# Altium project DC-Motor-Driver-v1.0.PrjPcb (part 1 of 3)
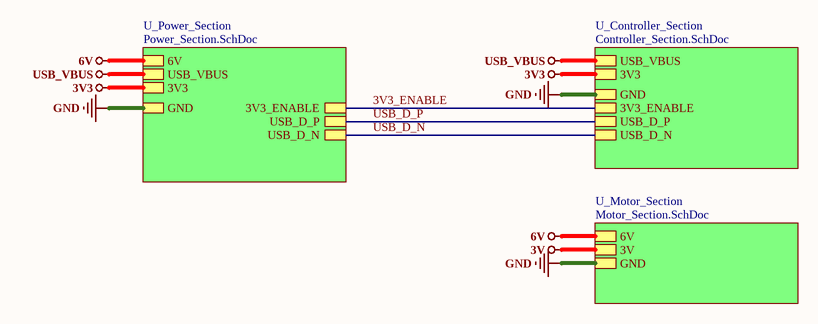
[diagram p0: TopSheet.SchDoc]
4 sheets, 133 parts. Net scope: global (net labels, ports and power ports of the same name join across sheets).
Board file: DC-Motor-Driver-v1.0.PcbDoc
Sheets:
  TopSheet.SchDoc
    U_Motor_Section = Motor_Section.SchDoc
    U_Power_Section = Power_Section.SchDoc
    U_Controller_Section = Controller_Section.SchDoc

## Sheet TopSheet.SchDoc
size A4; SheetNumber: 1; SheetTotal: 4

### Sub-sheets
U_Controller_Section = Controller_Section.SchDoc: GND, USB_VBUS, 3V3, USB_D_N, USB_D_P, 3V3_ENABLE
U_Motor_Section = Motor_Section.SchDoc: 3V, 6V, GND
U_Power_Section = Power_Section.SchDoc: GND, USB_VBUS, 3V3, 6V, USB_D_P, USB_D_N, 3V3_ENABLE

### Nets
3V: sheet U_Motor_Section/3V
3V3: sheet U_Power_Section/3V3, sheet U_Controller_Section/3V3
6V: sheet U_Motor_Section/6V, sheet U_Power_Section/6V
GND: sheet U_Motor_Section/GND, sheet U_Power_Section/GND, sheet U_Controller_Section/GND
USB_VBUS: sheet U_Power_Section/USB_VBUS, sheet U_Controller_Section/USB_VBUS
3V3_ENABLE: sheet U_Power_Section/3V3_ENABLE, sheet U_Controller_Section/3V3_ENABLE
USB_D_N: sheet U_Power_Section/USB_D_N, sheet U_Controller_Section/USB_D_N
USB_D_P: sheet U_Power_Section/USB_D_P, sheet U_Controller_Section/USB_D_P

### Notes on the sheet
- File:
- Title:
- Date:
- Page
- Num:
- Total:
- Drawn By: Huzaifa Ali

## Sheet Motor_Section.SchDoc
size 420 x 297 mm; SheetNumber: 4; SheetTotal: 4
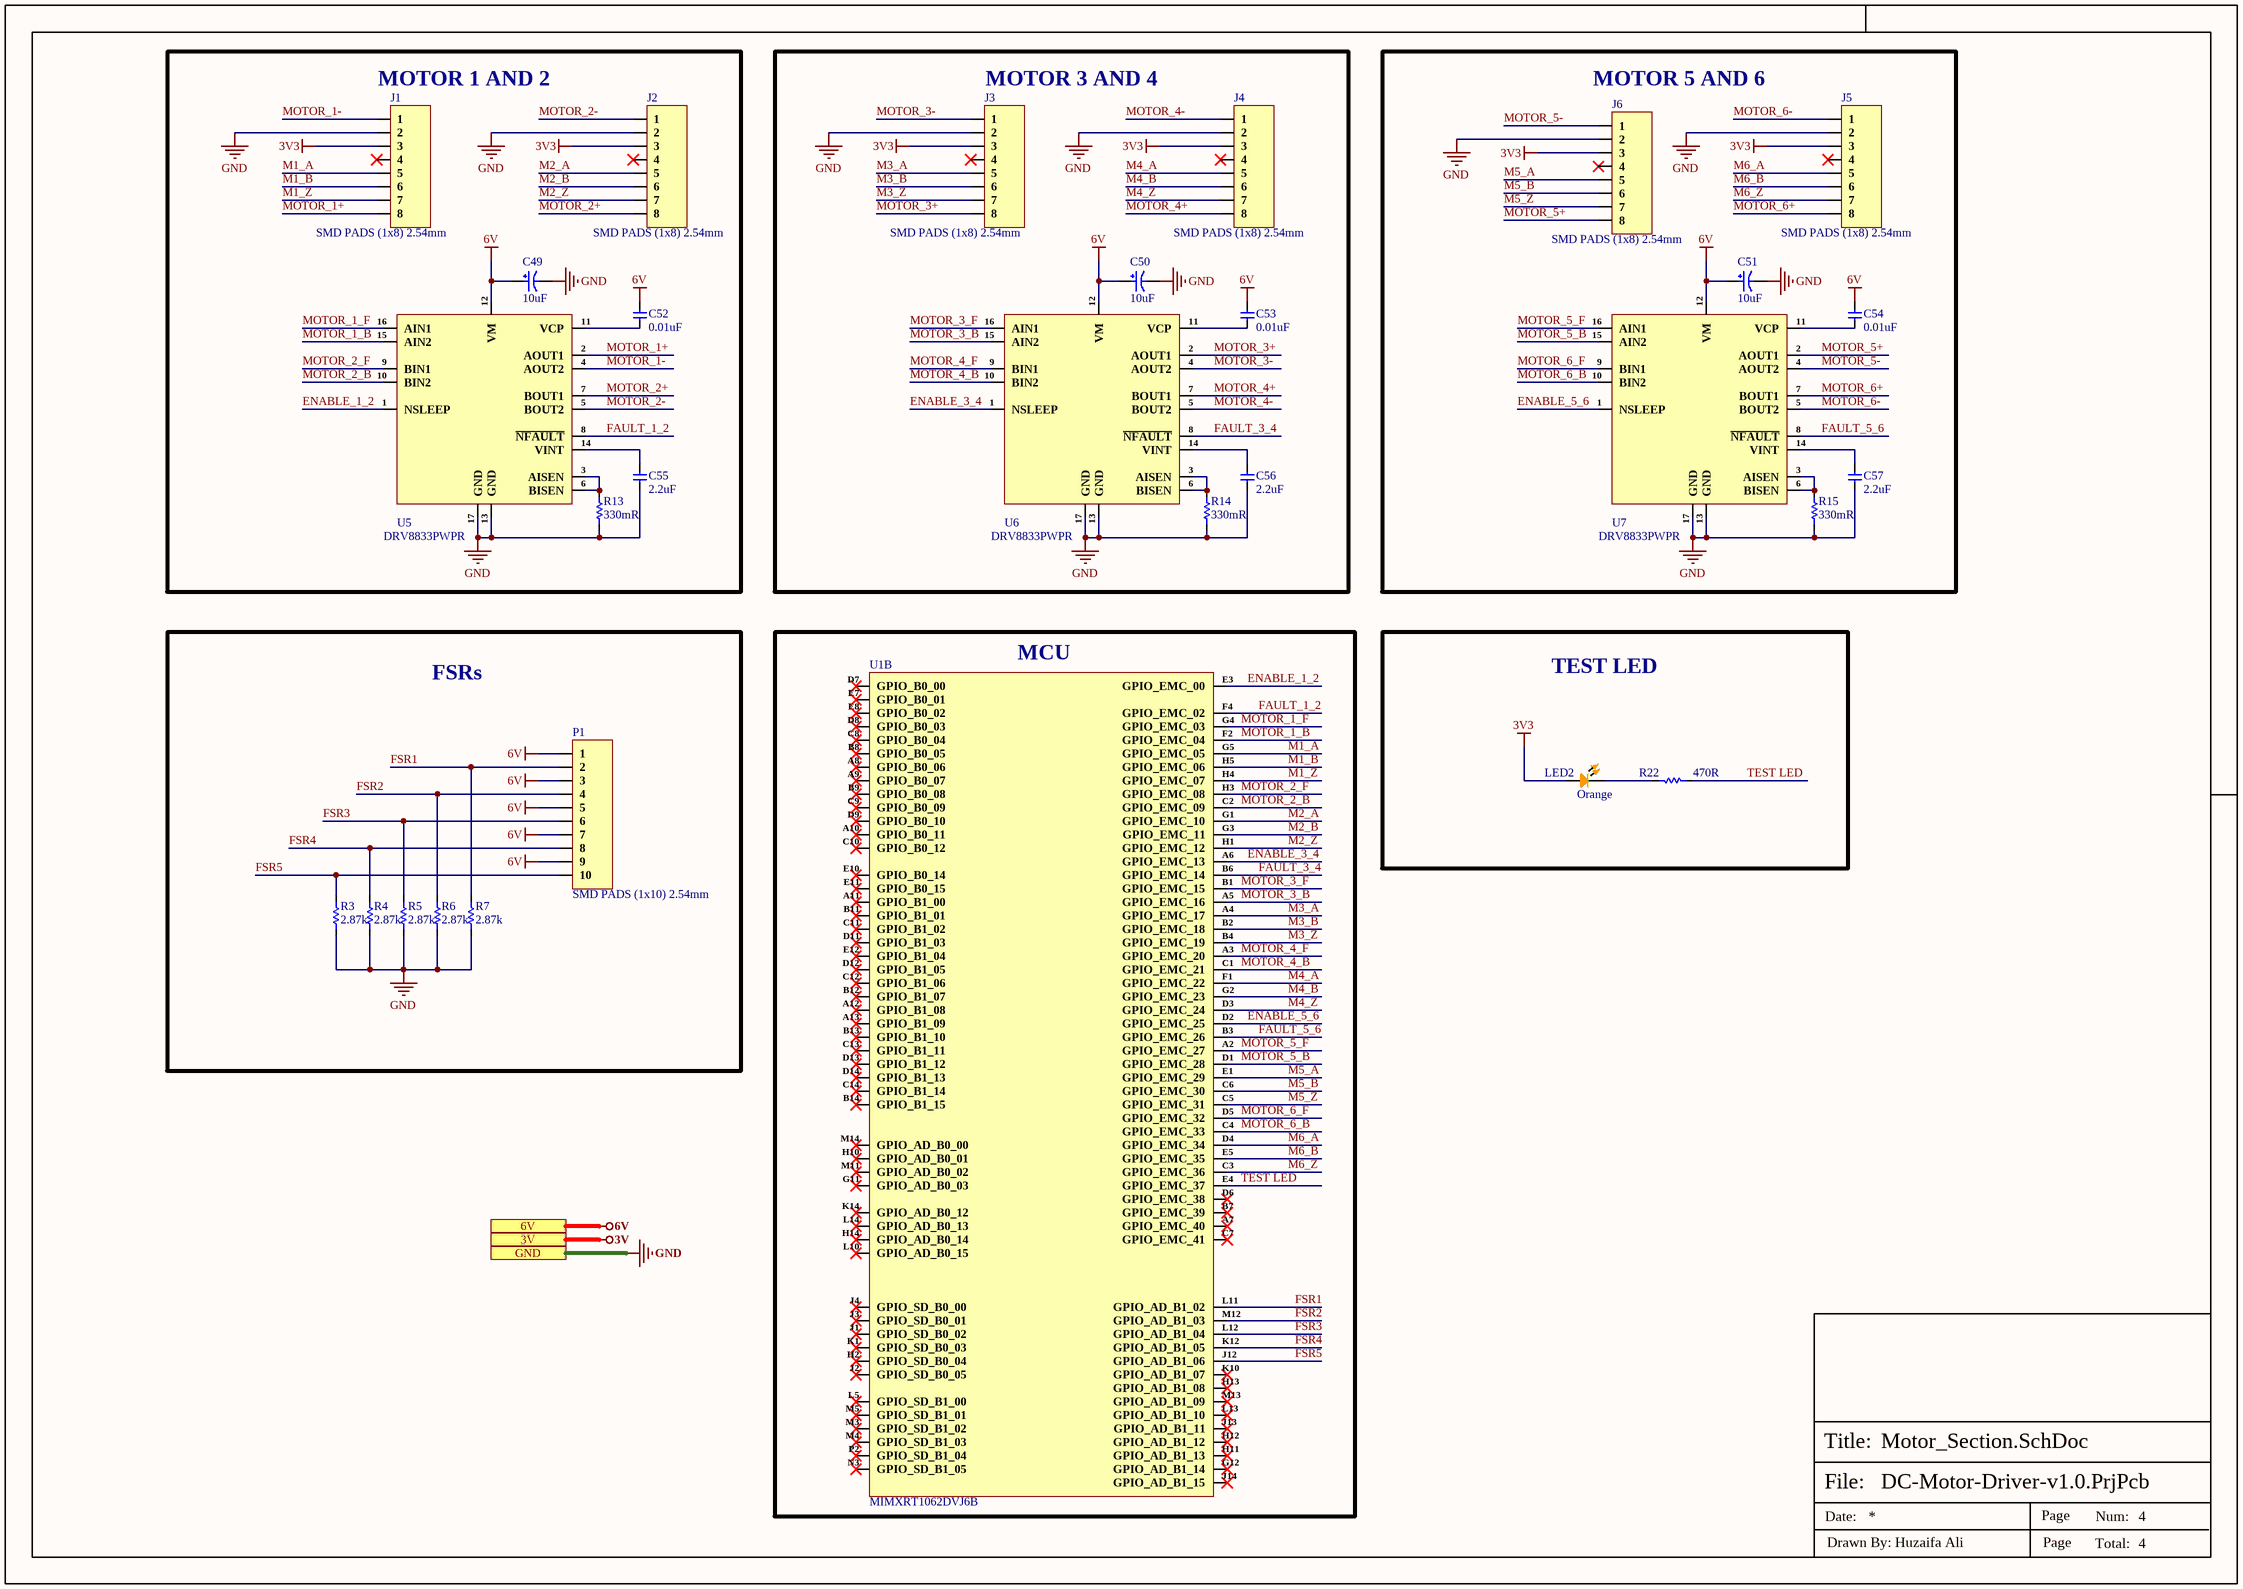
[diagram p1: Motor_Section.SchDoc]

### Parts
C49  10uF  [Case-A]
C50  10uF  [Case-A]
C51  10uF  [Case-A]
C52  0.01uF  [Cap-0402]
C53  0.01uF  [Cap-0402]
C54  0.01uF  [Cap-0402]
C55  2.2uF  [CAP-0603]
C56  2.2uF  [CAP-0603]
C57  2.2uF  [CAP-0603]
J1  SMD PADS (1x8) 2.54mm  [SMD PADS (1x8) 2.54mm]
J2  SMD PADS (1x8) 2.54mm  [SMD PADS (1x8) 2.54mm]
J3  SMD PADS (1x8) 2.54mm  [SMD PADS (1x8) 2.54mm]
J4  SMD PADS (1x8) 2.54mm  [SMD PADS (1x8) 2.54mm]
J5  SMD PADS (1x8) 2.54mm  [SMD PADS (1x8) 2.54mm]
J6  SMD PADS (1x8) 2.54mm  [SMD PADS (1x8) 2.54mm]
LED2  Orange  [LED-0805]
P1  SMD PADS (1x10) 2.54mm  [SMD PADS (1x10) 2.54mm]
R3  2.87k  [Res-0402]
R4  2.87k  [Res-0402]
R5  2.87k  [Res-0402]
R6  2.87k  [Res-0402]
R7  2.87k  [Res-0402]
R13  330mR  [Res-1206]
R14  330mR  [Res-1206]
R15  330mR  [Res-1206]
R22  470R  [Res-0201]
U1  MIMXRT1062DVJ6B  [196-LFBGA (12x12)]  (part B of 2)
U5  DRV8833PWPR  [HTSSOP-16]
U6  DRV8833PWPR  [HTSSOP-16]
U7  DRV8833PWPR  [HTSSOP-16]

### Blocks framed on the sheet
MOTOR 1 AND 2: C49 C52 C55 J1 J2 R13 U5
MOTOR 3 AND 4: C50 C53 C56 J3 J4 R14 U6
MOTOR 5 AND 6: C51 C54 C57 J5 J6 R15 U7
FSRs: P1 R3-R7
MCU: U1
TEST LED: LED2 R22

### Ports
3V, 6V, GND

### Nets
3V: port 3V
3V3: J1.3 J2.3 J3.3 J4.3 J5.3 J6.3 LED2.1
6V: C49.1 C50.1 C51.1 C52.2 C53.2 C54.2 P1.1 P1.3 P1.5 P1.7 P1.9 U5.12(VM) U6.12(VM) U7.12(VM) ; port 6V
GND: C49.2 C50.2 C51.2 C55.1 C56.1 C57.1 J1.2 J2.2 J3.2 J4.2 J5.2 J6.2 R3.1 R4.1 R5.1 R6.1 R7.1 R13.1 R14.1 R15.1 U5.13(GND) U5.17(GND) U6.13(GND) U6.17(GND) U7.13(GND) U7.17(GND) ; port GND
ENABLE_1_2: U1.E3(GPIO_EMC_00) U5.1(NSLEEP)
ENABLE_3_4: U1.A6(GPIO_EMC_13) U6.1(NSLEEP)
ENABLE_5_6: U1.D2(GPIO_EMC_25) U7.1(NSLEEP)
FAULT_1_2: U1.F4(GPIO_EMC_02) U5.8(~{NFAULT})
FAULT_3_4: U1.B6(GPIO_EMC_14) U6.8(~{NFAULT})
FAULT_5_6: U1.B3(GPIO_EMC_26) U7.8(~{NFAULT})
FSR1: P1.2 R7.2 U1.L11(GPIO_AD_B1_02)
FSR2: P1.4 R6.2 U1.M12(GPIO_AD_B1_03)
FSR3: P1.6 R5.2 U1.L12(GPIO_AD_B1_04)
FSR4: P1.8 R4.2 U1.K12(GPIO_AD_B1_05)
FSR5: P1.10 R3.2 U1.J12(GPIO_AD_B1_06)
M1_A: J1.5 U1.G5(GPIO_EMC_05)
M1_B: J1.6 U1.H5(GPIO_EMC_06)
M1_Z: J1.7 U1.H4(GPIO_EMC_07)
M2_A: J2.5 U1.G1(GPIO_EMC_10)
M2_B: J2.6 U1.G3(GPIO_EMC_11)
M2_Z: J2.7 U1.H1(GPIO_EMC_12)
M3_A: J3.5 U1.A4(GPIO_EMC_17)
M3_B: J3.6 U1.B2(GPIO_EMC_18)
M3_Z: J3.7 U1.B4(GPIO_EMC_19)
M4_A: J4.5 U1.F1(GPIO_EMC_22)
M4_B: J4.6 U1.G2(GPIO_EMC_23)
M4_Z: J4.7 U1.D3(GPIO_EMC_24)
M5_A: J6.5 U1.E1(GPIO_EMC_29)
M5_B: J6.6 U1.C6(GPIO_EMC_30)
M5_Z: J6.7 U1.C5(GPIO_EMC_31)
M6_A: J5.5 U1.D4(GPIO_EMC_34)
M6_B: J5.6 U1.E5(GPIO_EMC_35)
M6_Z: J5.7 U1.C3(GPIO_EMC_36)
MOTOR_1+: J1.8 U5.2(AOUT1)
MOTOR_1-: J1.1 U5.4(AOUT2)
MOTOR_1_B: U1.F2(GPIO_EMC_04) U5.15(AIN2)
MOTOR_1_F: U1.G4(GPIO_EMC_03) U5.16(AIN1)
MOTOR_2+: J2.8 U5.7(BOUT1)
MOTOR_2-: J2.1 U5.5(BOUT2)
MOTOR_2_B: U1.C2(GPIO_EMC_09) U5.10(BIN2)
MOTOR_2_F: U1.H3(GPIO_EMC_08) U5.9(BIN1)
MOTOR_3+: J3.8 U6.2(AOUT1)
MOTOR_3-: J3.1 U6.4(AOUT2)
MOTOR_3_B: U1.A5(GPIO_EMC_16) U6.15(AIN2)
MOTOR_3_F: U1.B1(GPIO_EMC_15) U6.16(AIN1)
MOTOR_4+: J4.8 U6.7(BOUT1)
MOTOR_4-: J4.1 U6.5(BOUT2)
MOTOR_4_B: U1.C1(GPIO_EMC_21) U6.10(BIN2)
MOTOR_4_F: U1.A3(GPIO_EMC_20) U6.9(BIN1)
MOTOR_5+: J6.8 U7.2(AOUT1)
MOTOR_5-: J6.1 U7.4(AOUT2)
MOTOR_5_B: U1.D1(GPIO_EMC_28) U7.15(AIN2)
MOTOR_5_F: U1.A2(GPIO_EMC_27) U7.16(AIN1)
MOTOR_6+: J5.8 U7.7(BOUT1)
MOTOR_6-: J5.1 U7.5(BOUT2)
MOTOR_6_B: U1.C4(GPIO_EMC_33) U7.10(BIN2)
MOTOR_6_F: U1.D5(GPIO_EMC_32) U7.9(BIN1)
TEST LED: R22.1 U1.E4(GPIO_EMC_37)
NetC52_1: C52.1 U5.11(VCP)
NetC53_1: C53.1 U6.11(VCP)
NetC54_1: C54.1 U7.11(VCP)
NetC55_2: C55.2 U5.14(VINT)
NetC56_2: C56.2 U6.14(VINT)
NetC57_2: C57.2 U7.14(VINT)
NetLED2_2: LED2.2 R22.2
NetR13_2: R13.2 U5.3(AISEN) U5.6(BISEN)
NetR14_2: R14.2 U6.3(AISEN) U6.6(BISEN)
NetR15_2: R15.2 U7.3(AISEN) U7.6(BISEN)

Not connected (* = marked no-connect by the designer): J1 4*; J2 4*; J3 4*; J4 4*; J5 4*; J6 4*; U1 A7(GPIO_EMC_40)* A8(GPIO_B0_06)* A9(GPIO_B0_07)* A10(GPIO_B0_11)* A11(GPIO_B1_00)* A12(GPIO_B1_08)* A13(GPIO_B1_09)* B7(GPIO_EMC_39)* B8(GPIO_B0_05)* B9(GPIO_B0_08)* B11(GPIO_B1_01)* B12(GPIO_B1_07)* B13(GPIO_B1_10)* B14(GPIO_B1_15)* C7(GPIO_EMC_41)* C8(GPIO_B0_04)* C9(GPIO_B0_09)* C10(GPIO_B0_12)* C11(GPIO_B1_02)* C12(GPIO_B1_06)* C13(GPIO_B1_11)* C14(GPIO_B1_14)* D6(GPIO_EMC_38)* D7(GPIO_B0_00)* D8(GPIO_B0_03)* D9(GPIO_B0_10)* D11(GPIO_B1_03)* D12(GPIO_B1_05)* D13(GPIO_B1_12)* D14(GPIO_B1_13)* E7(GPIO_B0_01)* E8(GPIO_B0_02)* E10(GPIO_B0_14)* E11(GPIO_B0_15)* E12(GPIO_B1_04)* G11(GPIO_AD_B0_03)* G12(GPIO_AD_B1_14)* H2(GPIO_SD_B0_04)* H10(GPIO_AD_B0_01)* H11(GPIO_AD_B1_13)* H12(GPIO_AD_B1_12)* H13(GPIO_AD_B1_08)* H14(GPIO_AD_B0_14)* J1(GPIO_SD_B0_02)* J2(GPIO_SD_B0_05)* J3(GPIO_SD_B0_01)* J4(GPIO_SD_B0_00)* J13(GPIO_AD_B1_11)* J14(GPIO_AD_B1_15)* K1(GPIO_SD_B0_03)* K10(GPIO_AD_B1_07)* K14(GPIO_AD_B0_12)* L5(GPIO_SD_B1_00)* L10(GPIO_AD_B0_15)* L13(GPIO_AD_B1_10)* L14(GPIO_AD_B0_13)* M3(GPIO_SD_B1_02)* M4(GPIO_SD_B1_03)* M5(GPIO_SD_B1_01)* M11(GPIO_AD_B0_02)* M13(GPIO_AD_B1_09)* M14(GPIO_AD_B0_00)* N3(GPIO_SD_B1_05)* P2(GPIO_SD_B1_04)*

### Notes on the sheet
- File:
- Title:
- Date:
- Page
- Num:
- Total:
- Drawn By: Huzaifa Ali

### Library data of the parts
C49-C51 = T491A106K016AT: CAP TANT 10UF 10% 16V 1206; Manufacturer: KEMET; Item Type: Capacitor; Supplier 1: Mouser; Manufacturer Part Number: T491A106K016AT; RoHS: Yes; Category: Tantalum Capacitors; Stock 1: 340138; Pricing 1: 1=0.34, 10=0.214, 50=0.214, 100=0.163, 1000=0.118, 10000=0.096 (USD); ComponentLink1URL: https://datasheet.ciiva.com/34302/1573257-34302505.pdf?src-supplier=Jameco; ComponentLink1Description: https://datasheet.ciiva.com/34302/1573257-34302505.pdf?src-supplier=Jameco; ComponentLink2URL: https://datasheet.ciiva.com/7696/1732745-7696294.pdf?src-supplier=Element14; ComponentLink2Description: https://datasheet.ciiva.com/7696/1732745-7696294.pdf?src-supplier=Element14; ComponentLink3URL: https://datasheet.ciiva.com/12882/kem-t2005-t491-12882730.pdf?src-supplier=Mouser; ComponentLink3Description: https://datasheet.ciiva.com/12882/kem-t2005-t491-12882730.pdf?src-supplier=Mouser; ComponentLink4URL: https://datasheet.ciiva.com/6248/kem-t2005-t491-6248087.pdf?src-supplier=Digi-Key; ComponentLink4Description: https://datasheet.ciiva.com/6248/kem-t2005-t491-6248087.pdf?src-supplier=Digi-Key; ComponentLink5URL: https://datasheet.ciiva.com/6248/kem-t2005-t491-6248088.pdf?src-supplier=Digi-Key; ComponentLink5Description: https://datasheet.ciiva.com/6248/kem-t2005-t491-6248088.pdf?src-supplier=Digi-Key; ComponentLink6URL: https://datasheet.ciiva.com/6248/kem-t2005-t491-6248089.pdf?src-supplier=Digi-Key; ComponentLink6Description: https://datasheet.ciiva.com/6248/kem-t2005-t491-6248089.pdf?src-supplier=Digi-Key; ComponentLink7URL: https://datasheet.ciiva.com/14113/t491serie-eng-tds-14113132.pdf?src-supplier=Distrelec; ComponentLink7Description: https://datasheet.ciiva.com/14113/t491serie-eng-tds-14113132.pdf?src-supplier=Distrelec; ComponentLink8URL: https://datasheet.ciiva.com/14605/70095774-14605543.pdf?src-supplier=Allied+Electronics; ComponentLink8Description: https://datasheet.ciiva.com/14605/70095774-14605543.pdf?src-supplier=Allied+Electronics; ComponentLink9URL: https://datasheet.ciiva.com/14586/70095774-14586694.pdf?src-supplier=Allied+Electronics; ComponentLink9Description: https://datasheet.ciiva.com/14586/70095774-14586694.pdf?src-supplier=Allied+Electronics; ComponentLink10URL: https://datasheet.ciiva.com/39123/kem-t2005-t491-39123278.pdf?src-supplier=Onlinecomponents.com; ComponentLink10Description: https://datasheet.ciiva.com/39123/kem-t2005-t491-39123278.pdf?src-supplier=Onlinecomponents.com; ComponentLink11URL: https://datasheet.ciiva.com/7696/1854511-7696293.pdf?src-supplier=Element14; ComponentLink11Description: https://datasheet.ciiva.com/7696/1854511-7696293.pdf?src-supplier=Element14; ComponentLink12URL: https://datasheet.ciiva.com/7696/1854511-7696295.pdf?src-supplier=Element14; ComponentLink12Description: https://datasheet.ciiva.com/7696/1854511-7696295.pdf?src-supplier=Element14; ComponentLink13URL: https://datasheet.ciiva.com/7696/1446014-7696296.pdf?src-supplier=Element14; ComponentLink13Description: https://datasheet.ciiva.com/7696/1446014-7696296.pdf?src-supplier=Element14; ComponentLink14URL: https://datasheet.ciiva.com/7696/1923792-7696431.pdf?src-supplier=Element14; ComponentLink14Description: https://datasheet.ciiva.com/7696/1923792-7696431.pdf?src-supplier=Element14; ComponentLink15URL: https://datasheet.ciiva.com/29244/458306-da-01-de-kondensator-10uf-3216-10pr-16v-85c-29244588.pdf?src-supplier=Conrad; ComponentLink15Description: https://datasheet.ciiva.com/29244/458306-da-01-de-kondensator-10uf-3216-10pr-16v-85c-29244588.pdf?src-supplier=Conrad; LCSC Part Number: C110055; Supplier Part Number 1: 80-T491A106K016
C52-C54 = CC0402KRX5R8BB103: CAP CER 10000PF 25V X5R 0402; Manufacturer: Yageo; Item Type: Capacitor; Supplier 1: Future Electronics; Manufacturer Part Number: CC0402KRX5R8BB103; RoHS: Yes; Category: Ceramic Capacitors; Stock 1: 140000; Pricing 1: 10000=0.00290, 40000=0.00270, 150000=0.00260, 250000=0.00250, 500000=0.00240 (USD); RoHS Compliant: Yes; Supplier Part Number 1: 2101932; LCSC Part Number: C576726; ComponentLink1Description: LCSC; ComponentLink1URL: https://www.lcsc.com/product-detail/Multilayer-Ceramic-Capacitors-MLCC-SMD-SMT_YAGEO-CC0402KRX5R8BB103_C576726.html
C55-C57 = CC0603KRX5R8BB225: CAP CER 2.2UF 25V X5R 0603; Manufacturer: Yageo; Tolerance: 10%; Item Type: Capacitor; Supplier 1: Digi-Key; Manufacturer Part Number: CC0603KRX5R8BB225; Stock 1: 687936; Pricing 1: 1=0.4, 10=0.276, 50=0.1932, 100=0.1656, 500=0.1242, 1000=0.10488 (USD); Mount: Surface Mount; Case/Package: 0603; Case Code (Metric): 1608; Case Code (Imperial): 0603; Weight: 7.1E-05oz; Min Operating Temperature: -55°C; Max Operating Temperature: 85°C; Packaging: Tape and Reel; Capacitance: 2.2uF; Dielectric: X5R; Voltage Rating: 25V; Termination: SMD/SMT; Resistor Type: Ceramic; Voltage Rating (DC): 25V; Package Quantity: 4000; Length: 1.6mm; Width: 0.031inch; Thickness: 0.037inch; Depth: 0.8mm; Radiation Hardening: No; Lead Free: Lead Free; Halogen Free: Halogen Free; RoHS Compliant: Yes; ComponentLink1URL: https://www.verical.com/server-webapp/html/getDatasheet?partID=782757&src-supplier=Verical; ComponentLink1Description: https://www.verical.com/server-webapp/html/getDatasheet?partID=782757&src-supplier=Verical; Supplier Part Number 1: 311-1786-1-ND; LCSC Part Number: C309478
LED2 = XL-2012UOC: Colorless transparence -30℃~+85℃ 601nm~603nm Positive post Orange 120° 55mW 0805 Light Emitting Diodes (LED) ROHS; Manufacturer: XINGLIGHT; Manufacture Part No: XL-2012UOC; Package: 0805; LCSC Part no: C965813
R3-R7 = RT0402BRD072K87L: RES SMD 2.87KOHM 0.1% 1/16W 0402; Manufacturer: Yageo; Item Type: Resistor; Supplier 1: Future Electronics; Manufacturer Part Number: RT0402BRD072K87L; RoHS: Yes; Category: Chip SMD Resistors; Stock 1: 10000; Pricing 1: 10000=0.0185, 20000=0.0181, 40000=0.0177, 50000=0.0176, 150000=0.0168 (USD); ComponentLink1URL: https://datasheet.ciiva.com/2582/pyu-rt-1-to-0-05-rohs-l-5-2582296.pdf?src-supplier=Digi-Key; ComponentLink1Description: https://datasheet.ciiva.com/2582/pyu-rt-1-to-0-05-rohs-l-5-2582296.pdf?src-supplier=Digi-Key; LCSC Part Number: C852707; Supplier Part Number 1: 2128457
R13-R15 = 1206W4F330LT5E: 250mW Thick Film Resistors ±800ppm/℃ ±1% 330mΩ 1206 Chip Resistor; Manufacturer: Uniroyal; Manufacturer Part Number: 1206W4F330LT5E; Footprint: 1206; LCSC Part Number: C25337; Item Type: Resistor; ComponentLink1Description: New link; ComponentLink1URL: https://www.lcsc.com/product-detail/Chip-Resistor-Surface-Mount_UNI-ROYAL-Uniroyal-Elec-1206W4F330LT5E_C25337.html
R22 = RC0201JR-07470RL: RES 470 OHM 5% 1/20W 0201; Manufacturer: Yageo; Temperature Coefficient: 200ppm/°C; Voltage Rating (DC): 25V; Max Power Dissipation: 50mW; Supplier 1: Digi-Key; Manufacturer Part Number: RC0201JR-07470RL; RoHS: Yes; Category: Chip SMD Resistors; Stock 1: 173754; Pricing 1: 1=0.10000, 10=0.02600, 100=0.01040, 1000=0.00466, 2500=0.00405, 5000=0.00334 (USD); Case/Package: 0201; Number of Pins: 2; Contact Plating: Tin,Matte; Case Code (Metric): 0603; Case Code (Imperial): 0201; Min Operating Temperature: -55°C; Max Operating Temperature: 125°C; Resistor Type: Thick Film; Tolerance: 5%; Resistance: 470R; Number of Terminations: 2; Termination: SMD/SMT; Features: Moisture Resistant; Power Rating: 50mW; Voltage Rating: 25V; Package Quantity: 1; Packaging: Tape and Reel; Length: 0.6mm; Width: 0.3mm; Height: 0.01inch; Depth: 0.3mm; Radiation Hardening: No; Military Standard: Not; Lead Free: Lead Free; REACH SVHC: No SVHC; ComponentLink1URL: https://datasheet.ciiva.com/5924/443682-5924928.pdf?src-supplier=Farnell; ComponentLink1Description: https://datasheet.ciiva.com/5924/443682-5924928.pdf?src-supplier=Farnell; ComponentLink2URL: https://datasheet.ciiva.com/8885/pyu-rc0201-51-rohs-l-8-8885600.pdf?src-supplier=Avnet; ComponentLink2Description: https://datasheet.ciiva.com/8885/pyu-rc0201-51-rohs-l-8-8885600.pdf?src-supplier=Avnet; ComponentLink3URL: https://datasheet.ciiva.com/28390/pyu-rc0201-51-rohs-l-8-28390376.pdf?src-supplier=Avnet+Europe; ComponentLink3Description: https://datasheet.ciiva.com/28390/pyu-rc0201-51-rohs-l-8-28390376.pdf?src-supplier=Avnet+Europe; ComponentLink4URL: https://datasheet.ciiva.com/8885/pyu-rc0201-51-rohs-l-8-8885642.pdf?src-supplier=Avnet; ComponentLink4Description: https://datasheet.ciiva.com/8885/pyu-rc0201-51-rohs-l-8-8885642.pdf?src-supplier=Avnet; ComponentLink5URL: https://datasheet.ciiva.com/2462/pyu-r-int-thick-7-2462802.pdf?src-supplier=Digi-Key; ComponentLink5Description: https://datasheet.ciiva.com/2462/pyu-r-int-thick-7-2462802.pdf?src-supplier=Digi-Key; ComponentLink6URL: https://datasheet.ciiva.com/2462/pyu-r-int-thick-7-2462803.pdf?src-supplier=Digi-Key; ComponentLink6Description: https://datasheet.ciiva.com/2462/pyu-r-int-thick-7-2462803.pdf?src-supplier=Digi-Key; ComponentLink7URL: https://datasheet.ciiva.com/2462/pyu-r-int-thick-7-2462804.pdf?src-supplier=Digi-Key; ComponentLink7Description: https://datasheet.ciiva.com/2462/pyu-r-int-thick-7-2462804.pdf?src-supplier=Digi-Key; Supplier Part Number 1: 311-470NCT-ND; LCSC Part Number: C163491
U1 = MIMXRT1062DVJ6B: IC MCU 32BIT EXT MEM 196LFBGA; Manufacturer: NXP Semiconductors; Supplier: Digi-Key; Supplier Part Number: 568-MIMXRT1062DVJ6B-ND; Manufacturer Part Number: MIMXRT1062DVJ6B; RoHS: Yes; Category: Uncategorized; Stock: 1142; Pricing: 1=15.93, 10=12.734, 189=10.75497, 567=10.68896, 945=10.09187 (USD)
U5-U7 = DRV8833PWPR: IC MOTOR DRIVER PAR 16HTSSOP; Manufacturer: Texas Instruments; Supplier: Digi-Key; Supplier Part Number: 296-29434-1-ND; Manufacturer Part Number: DRV8833PWPR; RoHS: Yes; Category: Motor Drivers; Stock: 4877; Pricing: 1=2.5, 10=2.246, 25=2.1184, 100=1.8049, 250=1.6948, 500=1.48294, 1000=1.22872 (USD); ComponentLink1URL: https://datasheet.ciiva.com/22697/1769096-22697185.pdf?src-supplier=Element14; ComponentLink1Description: https://datasheet.ciiva.com/22697/1769096-22697185.pdf?src-supplier=Element14; ComponentLink2URL: https://datasheet.ciiva.com/3229/drv8833-3229712.pdf?src-supplier=Avnet; ComponentLink2Description: https://datasheet.ciiva.com/3229/drv8833-3229712.pdf?src-supplier=Avnet; ComponentLink3URL: https://datasheet.ciiva.com/15109/getdatasheetpartid-344250-15109480.pdf?src-supplier=Verical; ComponentLink3Description: https://datasheet.ciiva.com/15109/getdatasheetpartid-344250-15109480.pdf?src-supplier=Verical; ComponentLink4URL: https://datasheet.ciiva.com/1500/1857491-1500620.pdf?src-supplier=Element14; ComponentLink4Description: https://datasheet.ciiva.com/1500/1857491-1500620.pdf?src-supplier=Element14; ComponentLink5URL: https://datasheet.ciiva.com/1958/drv8833-1958713.pdf?src-supplier=Digi-Key; ComponentLink5Description: https://datasheet.ciiva.com/1958/drv8833-1958713.pdf?src-supplier=Digi-Key; ComponentLink6URL: https://datasheet.ciiva.com/1958/drv8833-1958714.pdf?src-supplier=Digi-Key; ComponentLink6Description: https://datasheet.ciiva.com/1958/drv8833-1958714.pdf?src-supplier=Digi-Key; ComponentLink7URL: https://datasheet.ciiva.com/1958/drv8833-1958715.pdf?src-supplier=Digi-Key; ComponentLink7Description: https://datasheet.ciiva.com/1958/drv8833-1958715.pdf?src-supplier=Digi-Key; LCSC Part Number: C50506; Item Type: IC